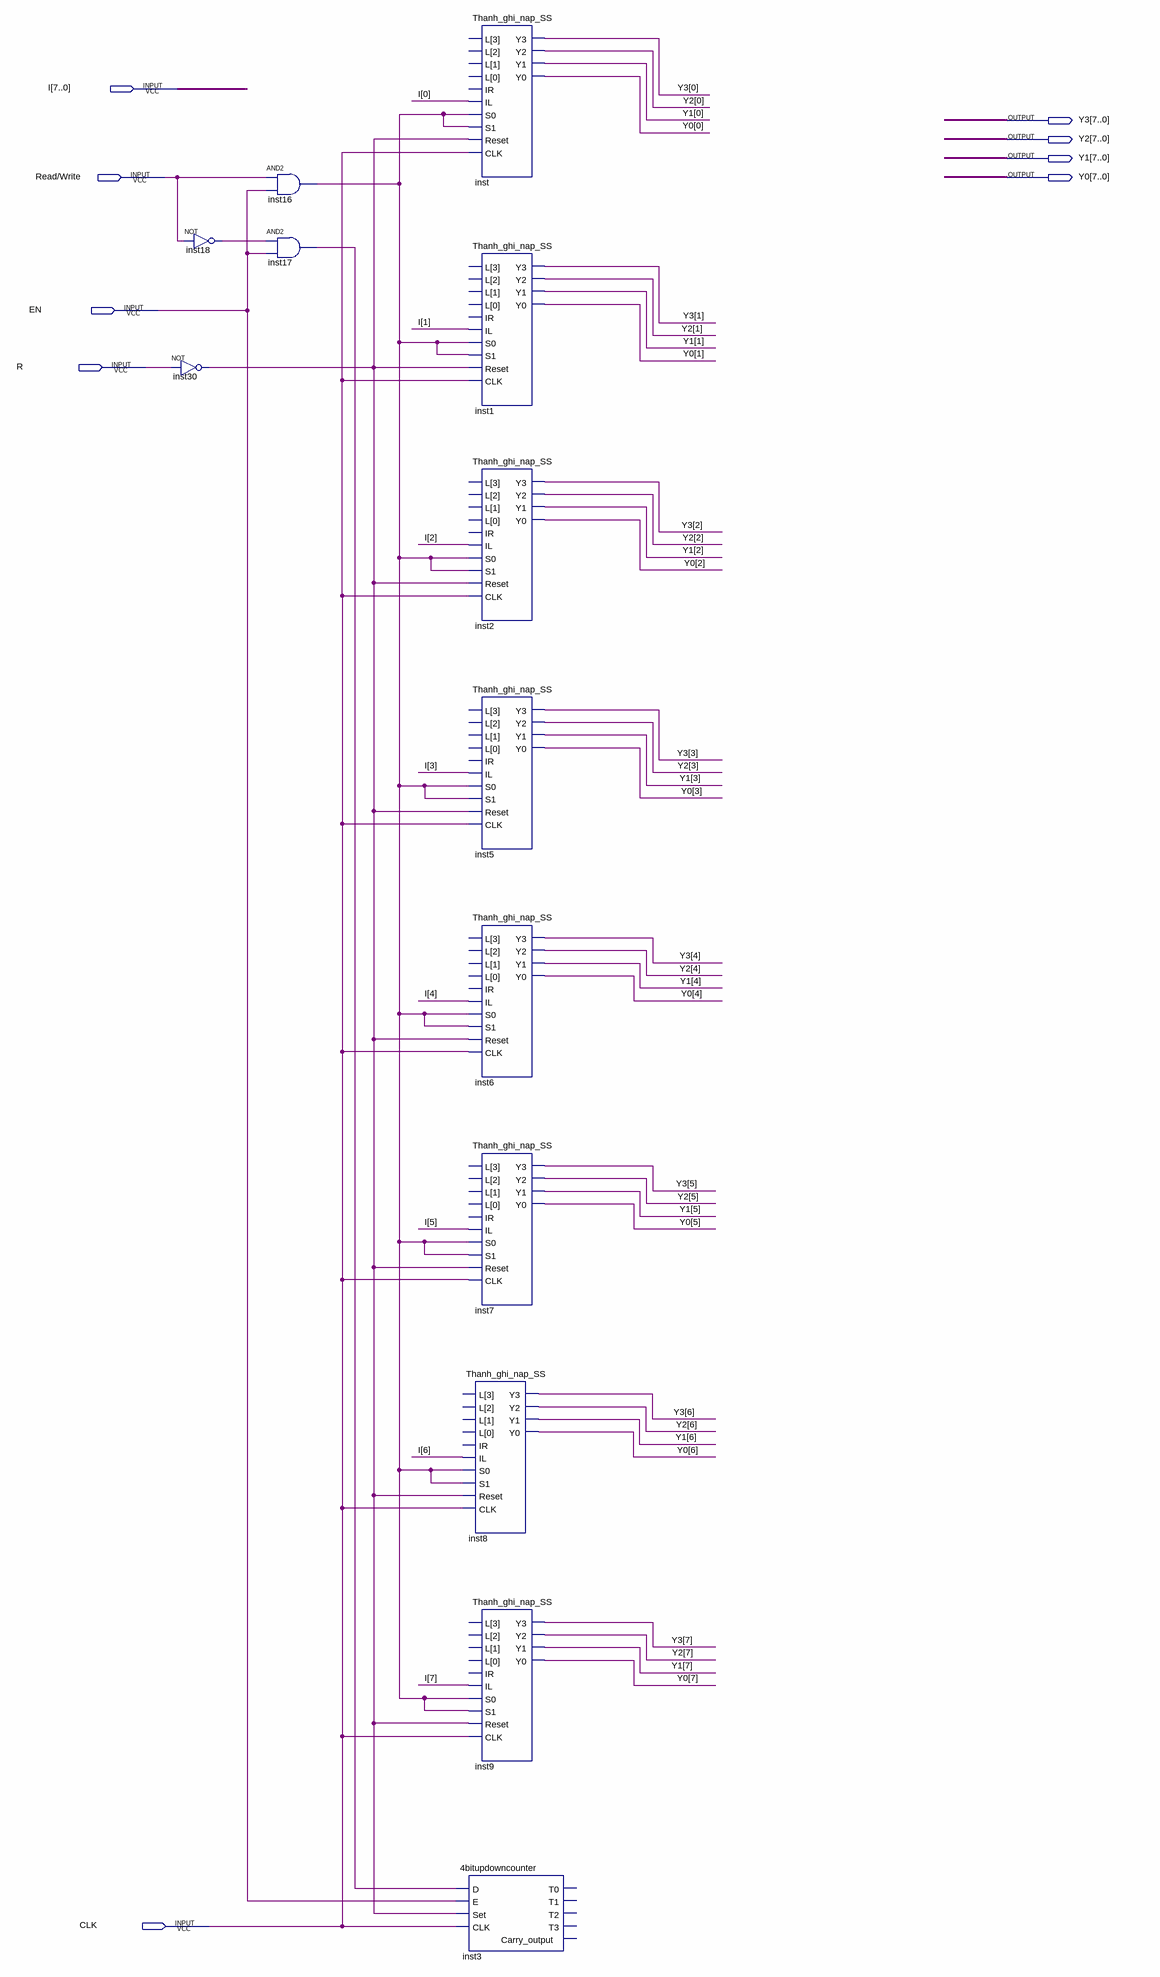
[diagram p0: schematic sheet]
// Quartus schematic FIFO.bdf as structural Verilog: 13 symbols, 9 pins
module FIFO (
  input  [7:0] I,
  input  \Read/Write ,
  input  EN,
  input  R,
  input  CLK,
  output [7:0] Y3,
  output [7:0] Y2,
  output [7:0] Y1,
  output [7:0] Y0
);

  wire inst16_out, inst17_out, inst18_out, inst30_out;

  not inst18 (inst18_out, \Read/Write );
  not inst30 (inst30_out, R);
  and inst16 (inst16_out, \Read/Write , EN);
  and inst17 (inst17_out, inst18_out, EN);
  Thanh_ghi_nap_SS inst (
    .IL(I[0]), .S0(inst16_out), .S1(inst16_out), .Reset(inst30_out), .CLK(CLK), .Y3(Y3[0]), .Y2(Y2[0]),
    .Y0(Y0[0]), .Y1(Y1[0]));  // open: IR, L
  Thanh_ghi_nap_SS inst1 (
    .IL(I[1]), .S0(inst16_out), .S1(inst16_out), .Reset(inst30_out), .CLK(CLK), .Y3(Y3[1]), .Y2(Y2[1]),
    .Y0(Y0[1]), .Y1(Y1[1]));  // open: IR, L
  Thanh_ghi_nap_SS inst2 (
    .IL(I[2]), .S0(inst16_out), .S1(inst16_out), .Reset(inst30_out), .CLK(CLK), .Y3(Y3[2]), .Y2(Y2[2]),
    .Y0(Y0[2]), .Y1(Y1[2]));  // open: IR, L
  Thanh_ghi_nap_SS inst5 (
    .IL(I[3]), .S0(inst16_out), .S1(inst16_out), .Reset(inst30_out), .CLK(CLK), .Y3(Y3[3]), .Y2(Y2[3]),
    .Y0(Y0[3]), .Y1(Y1[3]));  // open: IR, L
  Thanh_ghi_nap_SS inst6 (
    .IL(I[4]), .S0(inst16_out), .S1(inst16_out), .Reset(inst30_out), .CLK(CLK), .Y3(Y3[4]), .Y2(Y2[4]),
    .Y0(Y0[4]), .Y1(Y1[4]));  // open: IR, L
  Thanh_ghi_nap_SS inst7 (
    .IL(I[5]), .S0(inst16_out), .S1(inst16_out), .Reset(inst30_out), .CLK(CLK), .Y3(Y3[5]), .Y2(Y2[5]),
    .Y0(Y0[5]), .Y1(Y1[5]));  // open: IR, L
  Thanh_ghi_nap_SS inst8 (
    .IL(I[6]), .S0(inst16_out), .S1(inst16_out), .Reset(inst30_out), .CLK(CLK), .Y3(Y3[6]), .Y2(Y2[6]),
    .Y0(Y0[6]), .Y1(Y1[6]));  // open: IR, L
  Thanh_ghi_nap_SS inst9 (
    .IL(I[7]), .S0(inst16_out), .S1(inst16_out), .Reset(inst30_out), .CLK(CLK), .Y3(Y3[7]), .Y2(Y2[7]),
    .Y0(Y0[7]), .Y1(Y1[7]));  // open: IR, L
  \4bitupdowncounter  inst3 (
    .D(inst17_out), .E(EN), .Set(inst30_out), .CLK(CLK));  // open: T2, T1, T0, Carry_output, T3
endmodule
